# Altium schematic sheet rfr27_temp_monitor.SchDoc: RFR Temp Monitor
size A2; DrawnBy: Arjun Gilhotra; SheetNumber: 1; SheetTotal: 1
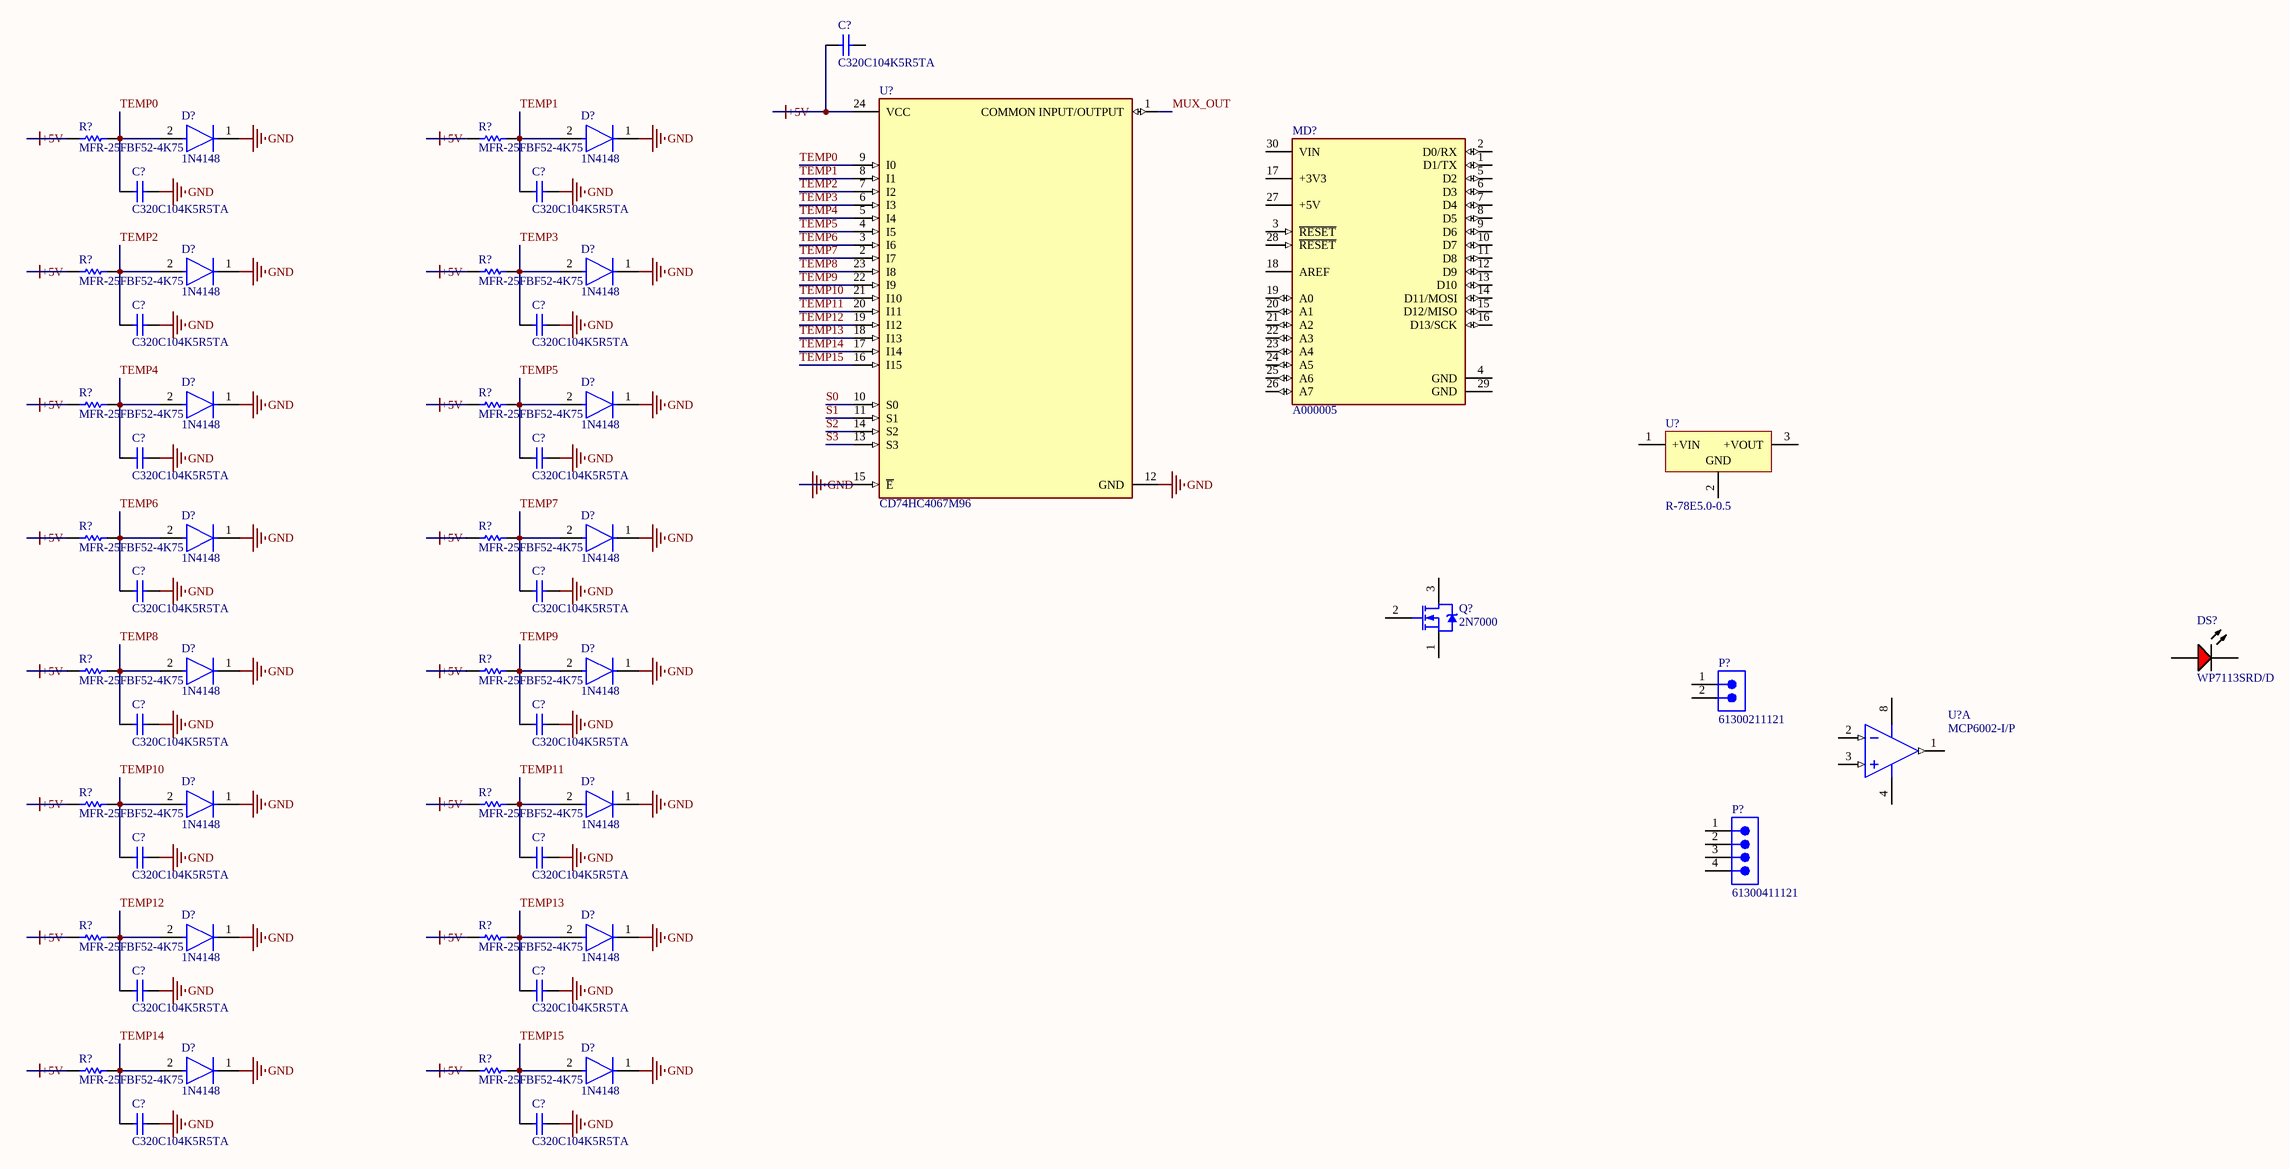
[diagram p0: rfr27_temp_monitor.SchDoc]

## Parts
(Parts that share a designator on the sheet are numbered #1, #2 ... from top to bottom, then left to right.)
C?#1  C320C104K5R5TA  [CAPR51-254-508X318X736]
C?#2  C320C104K5R5TA  [CAPR51-254-508X318X736]
C?#3  C320C104K5R5TA  [CAPR51-254-508X318X736]
C?#4  C320C104K5R5TA  [CAPR51-254-508X318X736]
C?#5  C320C104K5R5TA  [CAPR51-254-508X318X736]
C?#6  C320C104K5R5TA  [CAPR51-254-508X318X736]
C?#7  C320C104K5R5TA  [CAPR51-254-508X318X736]
C?#8  C320C104K5R5TA  [CAPR51-254-508X318X736]
C?#9  C320C104K5R5TA  [CAPR51-254-508X318X736]
C?#10  C320C104K5R5TA  [CAPR51-254-508X318X736]
C?#11  C320C104K5R5TA  [CAPR51-254-508X318X736]
C?#12  C320C104K5R5TA  [CAPR51-254-508X318X736]
C?#13  C320C104K5R5TA  [CAPR51-254-508X318X736]
C?#14  C320C104K5R5TA  [CAPR51-254-508X318X736]
C?#15  C320C104K5R5TA  [CAPR51-254-508X318X736]
C?#16  C320C104K5R5TA  [CAPR51-254-508X318X736]
C?#17  C320C104K5R5TA  [CAPR51-254-508X318X736]
D?#1  1N4148  [FP-017AG-MFG]
D?#2  1N4148  [FP-017AG-MFG]
D?#3  1N4148  [FP-017AG-MFG]
D?#4  1N4148  [FP-017AG-MFG]
D?#5  1N4148  [FP-017AG-MFG]
D?#6  1N4148  [FP-017AG-MFG]
D?#7  1N4148  [FP-017AG-MFG]
D?#8  1N4148  [FP-017AG-MFG]
D?#9  1N4148  [FP-017AG-MFG]
D?#10  1N4148  [FP-017AG-MFG]
D?#11  1N4148  [FP-017AG-MFG]
D?#12  1N4148  [FP-017AG-MFG]
D?#13  1N4148  [FP-017AG-MFG]
D?#14  1N4148  [FP-017AG-MFG]
D?#15  1N4148  [FP-017AG-MFG]
D?#16  1N4148  [FP-017AG-MFG]
DS?  WP7113SRD/D  [KING-WP7113SRDD_V]
MD?  A000005  [FP-A000005-MFG]
P?#1  61300211121  [61300211121]
P?#2  61300411121  [61300411121]
Q?  2N7000  [ONSC-TO-92-3-29-11]
R?#1  MFR-25FBF52-4K75  [RESA60-630X240]
R?#2  MFR-25FBF52-4K75  [RESA60-630X240]
R?#3  MFR-25FBF52-4K75  [RESA60-630X240]
R?#4  MFR-25FBF52-4K75  [RESA60-630X240]
R?#5  MFR-25FBF52-4K75  [RESA60-630X240]
R?#6  MFR-25FBF52-4K75  [RESA60-630X240]
R?#7  MFR-25FBF52-4K75  [RESA60-630X240]
R?#8  MFR-25FBF52-4K75  [RESA60-630X240]
R?#9  MFR-25FBF52-4K75  [RESA60-630X240]
R?#10  MFR-25FBF52-4K75  [RESA60-630X240]
R?#11  MFR-25FBF52-4K75  [RESA60-630X240]
R?#12  MFR-25FBF52-4K75  [RESA60-630X240]
R?#13  MFR-25FBF52-4K75  [RESA60-630X240]
R?#14  MFR-25FBF52-4K75  [RESA60-630X240]
R?#15  MFR-25FBF52-4K75  [RESA60-630X240]
R?#16  MFR-25FBF52-4K75  [RESA60-630X240]
U?#1  CD74HC4067M96  [FP-DW0024A-MFG]
U?#2  R-78E5.0-0.5  [REPO-R-78E-0.5-3_V]
U?#3  MCP6002-I/P  [PDIP300-P8]  (part A of 2)

## Nets
+5V: C?#1.1 R?#1.1 R?#2.1 R?#3.1 R?#4.1 R?#5.1 R?#6.1 R?#7.1 R?#8.1 R?#9.1 R?#10.1 R?#11.1 R?#12.1 R?#13.1 R?#14.1 R?#15.1 R?#16.1 U?#1.24(VCC)
GND: C?#2.2 C?#3.2 C?#4.2 C?#5.2 C?#6.2 C?#7.2 C?#8.2 C?#9.2 C?#10.2 C?#11.2 C?#12.2 C?#13.2 C?#14.2 C?#15.2 C?#16.2 C?#17.2 D?#1.1(C) D?#2.1(C) D?#3.1(C) D?#4.1(C) D?#5.1(C) D?#6.1(C) D?#7.1(C) D?#8.1(C) D?#9.1(C) D?#10.1(C) D?#11.1(C) D?#12.1(C) D?#13.1(C) D?#14.1(C) D?#15.1(C) D?#16.1(C) U?#1.12(GND) U?#1.15(~{E})
MUX_OUT: U?#1.1(COMMON_INPUT/OUTPUT)
S0: U?#1.10(S0)
S1: U?#1.11(S1)
S2: U?#1.14(S2)
S3: U?#1.13(S3)
TEMP0: C?#2.1 D?#1.2(A) R?#1.2 U?#1.9(I0)
TEMP1: C?#3.1 D?#2.2(A) R?#2.2 U?#1.8(I1)
TEMP2: C?#4.1 D?#3.2(A) R?#3.2 U?#1.7(I2)
TEMP3: C?#5.1 D?#4.2(A) R?#4.2 U?#1.6(I3)
TEMP4: C?#6.1 D?#5.2(A) R?#5.2 U?#1.5(I4)
TEMP5: C?#7.1 D?#6.2(A) R?#6.2 U?#1.4(I5)
TEMP6: C?#8.1 D?#7.2(A) R?#7.2 U?#1.3(I6)
TEMP7: C?#9.1 D?#8.2(A) R?#8.2 U?#1.2(I7)
TEMP8: C?#10.1 D?#9.2(A) R?#9.2 U?#1.23(I8)
TEMP9: C?#11.1 D?#10.2(A) R?#10.2 U?#1.22(I9)
TEMP10: C?#12.1 D?#11.2(A) R?#11.2 U?#1.21(I10)
TEMP11: C?#13.1 D?#12.2(A) R?#12.2 U?#1.20(I11)
TEMP12: C?#14.1 D?#13.2(A) R?#13.2 U?#1.19(I12)
TEMP13: C?#15.1 D?#14.2(A) R?#14.2 U?#1.18(I13)
TEMP14: C?#16.1 D?#15.2(A) R?#15.2 U?#1.17(I14)
TEMP15: C?#17.1 D?#16.2(A) R?#16.2 U?#1.16(I15)

Not connected (* = marked no-connect by the designer): C?#1 2; DS? 1(A) 2(K); MD? 1(D1/TX) 2(D0/RX) 3(~{RESET}) 4(GND) 5(D2) 6(D3) 7(D4) 8(D5) 9(D6) 10(D7) 11(D8) 12(D9) 13(D10) 14(D11/MOSI) 15(D12/MISO) 16(D13/SCK) 17(+3V3) 18(AREF) 19(A0) 20(A1) 21(A2) 22(A3) 23(A4) 24(A5) 25(A6) 26(A7) 27(+5V) 28(~{RESET}) 29(GND) 30(VIN); P?#1 1 2; P?#2 1 2 3 4; Q? 1(S) 2(G) 3(D); U?#2 1(+VIN) 2(GND) 3(+VOUT); U?#3 1(VOUTA) 2(VINA-) 3(VINA+) 4(VSS) 8(VDD)

## Library data of the parts
C?#1-C?#17 = CMP-1664-00004-1: Radial Leaded Multilayer Ceramic Capacitor, 0.1 uF, +/- 10%, 50 V, -55 to 125 degC, 2-Pin THD, RoHS, Tape and Reel; Case\Package: SOT-23-5; Max Power Dissipation: 250 mW; Output Current: 150 mA; Dropout Voltage: 260 mV; Outputs: 1; Output Voltage: 5 V; Max Input Voltage: 8 V; Min Operating Temperature: -40 degC; Packaging: Tape and Reel; Height: 1.3 mm; Radiation Hardening: No; Pins: 5; ComponentLink1Description: Manufacturer URL; Mount: Surface Mount; RoHSCompliant: true; Max Operating Temperature: 85 degC; PackageReference: CAPR51-254-508X318X736; ComponentLink2URL: http://www.kemet.com/docfinder?Partnumber=C320C104K5R5TA; PackageDescription: 2-Pin Through Hole Device, Body 5.08 x 3.18 mm, Pitch 2.54 mm; ComponentLink1URL: http://www.kemet.com/; Width: 1.8 mm; Package Quantity: 3000; DatasheetVersion: Dec-15; Length: 3 mm; ComponentLink2Description: Datasheet
D?#1-D?#16 = CMP-07163-000046-1: DIODE GEN PURP 100V 200MA DO35; Forward Voltage: 1V; Max Power Dissipation: 500mW; Max Reverse Current: 5uA; Forward Current: 300mA; Current: 4A; Reverse Recovery Time: 4ns; Element Configuration: Single; Outside Diameter: 1.85mm; Capacitance: 4pF; Polarity: Standard; Max Forward Surge Current (Ifsm): 1A; Reverse Voltage: 100V; Output Current: 200mA; Average Rectified Current: 200mA; Diameter: 1.91mm; Max Repetitive Reverse Voltage (Vrrm): 100V; Current Rating: 200mA; Case/Package: DO-35; Lead Free: Lead Free; Number of Pins: 2; Recovery Time: 4ns; Packaging: Bulk; Contact Plating: Tin; Voltage: 100V; Mount: Through Hole; Max Surge Current: 4A; Package Quantity: 2000; Width: 1.91mm; Max Reverse Voltage (DC): 100V; Length: 4.56mm; Radiation Hardening: No; Power Dissipation: 500mW; Voltage Rating (DC): 100V; Peak Non-Repetitive Surge Current: 4A; REACH SVHC: No SVHC; Height: 4.56mm; Max Operating Temperature: 175°C; Series: -; Weight: 0.01lb; Min Operating Temperature: -65°C
DS? = CMP-1757-00002-1: The Super Bright Red Source Color Device, 1.85 V, -40 to 85 degC, 2-Pin THD, RoHS, Tape and Reel; Density: 1 MB; Min Supply Voltage: 1.71 V; Max Clock Frequency: 120 MHz; Max Supply Voltage: 3.6 V; Interface: UART; RAM Size: 128 KB; Case\Package: LQFP; Max Operating Temperature: 105 degC; Weight: 0.012224 oz; REACH SVHC: No SVHC; DatasheetVersion: Rev. 6A, 07/2016; Package Quantity: 160; Packaging: Tray; ComponentLink1Description: Datasheet; Min Operating Temperature: -40 degC; PackageDescription: 2-Pin Through Hole Device, Dia 5.9 mm, Body Length 8.6 mm; Pins: 64; PackageReference: WP7113SRDD; ComponentLink1URL: http://www.kingbrightusa.com/images/catalog/SPEC/WP7113SRD-D.pdf; RoHSCompliant: true
MD? = CMP-189986-000002-1: ARDUINO NANO ATMEGA328 EVAL BRD; Number of Bits: 8; Evaluation Kit: Yes; Operating Supply Voltage: 12V; Interface: I2C; Data Bus Width: 8b; Core Architecture: AVR; Packaging: Bulk; Length: 7inch; Package Quantity: 50; Width: 5inch; REACH SVHC: No SVHC; Weight: 0.358383oz; Series: AVR® ATmega; Height: 0.25inch
P?#1 = CMP-1712-00002-7: THT Vertical Pin Header WR-PHD, Pitch 2.54 mm, Single Row, 2 pins; Pitch: 2.54mm; Number of Contacts: 2; Connector Type: Male Pin; Gender: Male; Contact Resistance: 20mΩ; Operating Supply Voltage: 250V; Current Rating: 3A; Housing Material: PBT; RoHS: Compliant; Lead Free: Lead Free; Contact Material: Gold; REACH SVHC: No; Min Operating Temperature: -40°C; Termination: Through Hole; Number of Pins: 2; Contact Gender: Male; Packaging: Bulk; Lead Pitch: 2.54mm; Contact Plating: Gold; Orientation: Vertical; Mount: Through Hole; Height: 8.94mm; Color: Black; Number of Positions: 2; Contact Mating Length: 5.9944mm; Max Operating Temperature: 105°C; Voltage Rating: 250V; Number of Rows: 1
P?#2 = CMP-1502-01064-4: THT Vertical Pin Header WR-PHD, Pitch 2.54 mm, Single Row, 4 pins; Connector Type: Male Pin; Gender: Male; Current Rating: 3A; Number of Positions: 4; Operating Supply Voltage: 250V; Contact Resistance: 20mΩ; Pitch: 2.54mm; Max Operating Temperature: 105°C; Mount: Through Hole; Contact Material: Gold; Contact Plating: Gold; Number of Contacts: 4; Orientation: Vertical; Packaging: Bulk; Contact Mating Length: 5.9944mm; Voltage Rating: 250V; Number of Rows: 1; Height: 8.89mm; Lead Free: Lead Free; Lead Pitch: 2.54mm; Number of Pins: 4; Color: Black; Min Operating Temperature: -40°C; RoHS: Compliant; Termination: Solder
Q? = CMP-1058-00936-1: Small Signal MOSFET, 200 mA, 60 V, N-Channel, 3-Pin TO-92, Bulk Box; Manufacturer: On Semiconductor; Ciss Typ (pF): 60; VGS(th) Max (V): 3; Crss Typ (pF): 5; Channel Polarity: N Channel; VGS Max (V): 20; Configuration: Single; PD Max (W): 0.35; Coss Typ (pF): 25; ID Max (A): 0.2; PackageVersion: Rev. AM; ComponentLink3URL: http://www.onsemi.cn/pub_link/Collateral/2N6426-D.PDF; ComponentLink2URL: http://www.onsemi.com/pub_link/Collateral/2N7000-D.PDF; DatasheetVersion: Rev. 8; Mounting Technology: Through Hole; V(BR)DSS Min (V): 60; PartNumber: 2N7000; PackageDescription: 3-Pin Transistor Outline, Body 4.825 x 3.685 mm, Pitch 1.27 mm; ComponentLink2Description: Datasheet; ComponentLink1URL: http://www.onsemi.com/; PackageReference: TO-92-3-29-11_AM_SL; Packing: Bulk Box; ComponentLink1Description: Manufacturer URL; Package Type: TO-92; ComponentLink3Description: Package Specification
R?#1-R?#16 = CMP-1659-00066-1: Axial Resistor, 4.75 KOhm, +/- 1%, 0.25 W, -55 to 155 degC, 2-Pin THD, RoHS, Bulk; Case\Package: 1210; Voltage Rating (DC): 25 V; Type (Capacitors): X7R; Capacitance: 22 uF; Tolerance: 10%; PackageReference: MFR-25; DatasheetVersion: Apr-13; PackageDescription: 2-Pin Axial Lead, Dia 2.4 mm, Body Length 6.3 mm; ComponentLink1URL: http://www.yageo.com/; Radiation Hardening: No; Mount: Surface Mount; Height: 2.5 mm; Pins: 2; Package Quantity: 1000; REACH SVHC: No SVHC; Case Code (Imperial): 1210; Packaging: Tape and Reel; Max Operating Temperature: 125 degC; Case Code (Metric): 3225; ComponentLink1Description: Manufacturer URL; Min Operating Temperature: -55 degC; ComponentLink2Description: Datasheet; Voltage Rating: 25 V; Length: 3.2 mm; ComponentLink2URL: http://www.yageo.com/documents/recent/Yageo%20LR_MFR_2013.pdf; RoHSCompliant: true; Width: 2.5 mm
U?#1 = CMP-04901-000007-1: IC MUX/DEMUX 1X16 24SOIC; Manufacturer: Texas Instruments; Standoff Height: 0.1mm; Logic Function Desc: Non-Inverting; Max Supply Voltage: 6V; Number Of Inputs: 16; Quiescent Current: 8uA; Number Of Circuits: 1; Propagation Delay: 6ns; Max Junction Temp: +150°C; Min Supply Voltage: 2V; ComponentLink2Description: Datasheet; Octopart: https://octopart.com/cd74hc4067m96-texas+instruments-722802; Ambient Temperature Range High: +125°C; Ipc Land Pattern Name: SOIC127P1030X265-24; Height: 2.65mm; Mouser Description: Multiplexer Switch ICs Hi-Spd CMOS 16Ch Anl Mltplxr/Demltplxr; Temperature Range Low: -55°C; Package: DW0024A; Temperature Range High: +125°C; Lead Free: Yes; ComponentLink2URL: http://www.ti.com/lit/ds/symlink/cd74hc4067.pdf; Manufacturer Part Number: CD74HC4067M96; RoHS: TRUE; Automotive: No; Device Class L1: Integrated Circuits (ICs); Digikey Description: IC MUX/DEMUX 1X16 24SOIC; Device Class L2: Logic ICs; Temperature: -55°C to +125°C; Device Class L3: Multiplexers; Category: IC; Ambient Temperature Range Low: -55°C; Number Of Outputs: 1
U?#2 = CMP-2000-06922-2: DC/DC-Converter, 5 V Single Output, 500 mA, -40 to 85 degC, 3-Pin THD, RoHS, Tube; Manufacturer: Recom Power; Efficiency: 92%; Number of Outputs: 1; Current - Output (Max): 500mA; VIN Min: 7V; Package Version: Rev. 0; VIN Max: 28V; VOUT: 5V; Manufacturer URL: http://www.recom-power.com/us/americas/home.html; Operating Temperature: -40°C~85°C; Datasheet Version: 01/2017; Packaging: Tube; Package Reference: SIP Module; Datasheet URL: http://www.recom-power.com/pdf/Innoline/R-78Exx-0.5.pdf; Package Description: 3-Pin Through Hole Device, Body 11.6 x 8.5 mm, Pitch 2.54 mm; Mounting Technology: ThroughHole
U?#3 = CMP-0187-00119-3: None; Max Frequency: 1kHz; Operating Supply Current: 100uA; Amplifier Type: GENERAL PURPOSE; Number of Channels: 2; Power Supply Rejection Ratio (PSRR): 86dB; Max Input Voltage: 6V; Bandwidth: 1MHz; Voltage Gain: 112dB; Input Bias Current: 1pA; Slew Rate-Nom: 0.6V/µs; Output Current: 23mA; Input Offset Voltage-Max: 4.5mV; Common Mode Rejection Ratio: 60dB; Min Input Voltage: 1.8V; Operating Supply Voltage: 5.5V; Height: 0.195inch; Number of Circuits: 2; REACH SVHC: No SVHC; Max Supply Voltage: 6V; Supply Current: 100uA; Gain Bandwidth Product: 1MHz; Radiation Hardening: No; Mount: Through Hole; Length: 0.4inch; Number of Pins: 8; Min Operating Temperature: -40°C; Case/Package: PDIP; Number of Amplifiers: 2; RoHS Compliant: Yes; Lead Free: Lead Free; Number of Elements: 2; Technology: CMOS; Width: 0.28inch; Slew Rate: 0.6V/µs; Packaging: Rail/Tube; Output Current per Channel: 23mA; Max Operating Temperature: 85°C; Nominal Supply Current: 100uA; Min Supply Voltage: 1.8V; Input Offset Voltage (Vos): 4.5mV; Unity Gain Bandwidth Product: 1MHz; Package Quantity: 60